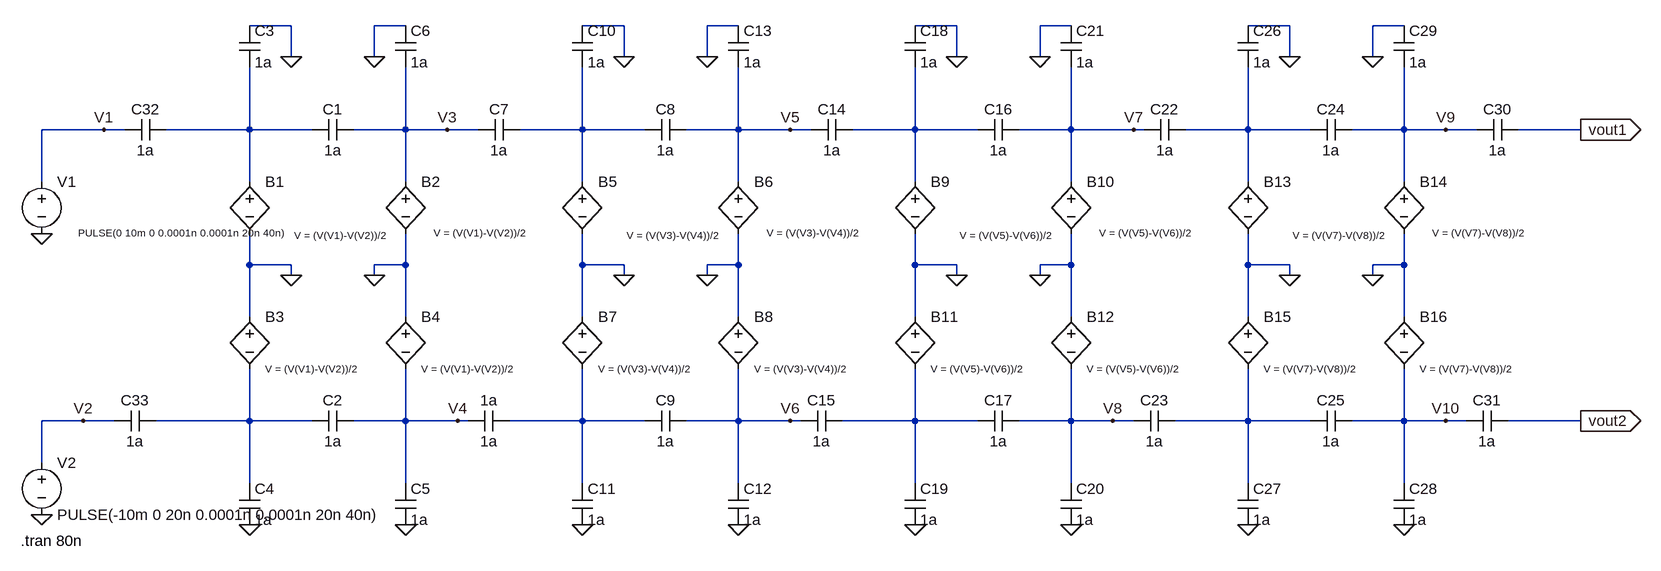
[diagram p0: schematic wire_in_ltspice.asc]
wire_in_ltspice.asc, the LTspice schematic file:
Version 4.1
SHEET 1 2044 680
WIRE -64 -256 -128 -256
WIRE 112 -256 64 -256
WIRE 448 -256 384 -256
WIRE 624 -256 576 -256
WIRE 960 -256 896 -256
WIRE 1136 -256 1088 -256
WIRE 1472 -256 1408 -256
WIRE 1648 -256 1600 -256
WIRE -64 -208 -64 -256
WIRE 64 -208 64 -256
WIRE 448 -208 448 -256
WIRE 576 -208 576 -256
WIRE 960 -208 960 -256
WIRE 1088 -208 1088 -256
WIRE 1472 -208 1472 -256
WIRE 1600 -208 1600 -256
WIRE -352 -96 -448 -96
WIRE -320 -96 -352 -96
WIRE -128 -96 -128 -192
WIRE -128 -96 -256 -96
WIRE -32 -96 -128 -96
WIRE 112 -96 112 -192
WIRE 112 -96 32 -96
WIRE 176 -96 112 -96
WIRE 224 -96 176 -96
WIRE 384 -96 384 -192
WIRE 384 -96 288 -96
WIRE 480 -96 384 -96
WIRE 624 -96 624 -192
WIRE 624 -96 544 -96
WIRE 704 -96 624 -96
WIRE 736 -96 704 -96
WIRE 896 -96 896 -192
WIRE 896 -96 800 -96
WIRE 992 -96 896 -96
WIRE 1136 -96 1136 -192
WIRE 1136 -96 1056 -96
WIRE 1232 -96 1136 -96
WIRE 1248 -96 1232 -96
WIRE 1408 -96 1408 -192
WIRE 1408 -96 1312 -96
WIRE 1504 -96 1408 -96
WIRE 1648 -96 1648 -192
WIRE 1648 -96 1568 -96
WIRE 1712 -96 1648 -96
WIRE 1760 -96 1712 -96
WIRE 1920 -96 1824 -96
WIRE -448 -16 -448 -96
WIRE -128 -16 -128 -96
WIRE 112 -16 112 -96
WIRE 384 -16 384 -96
WIRE 624 -16 624 -96
WIRE 896 -16 896 -96
WIRE 1136 -16 1136 -96
WIRE 1408 -16 1408 -96
WIRE 1648 -16 1648 -96
WIRE -128 112 -128 64
WIRE -64 112 -128 112
WIRE 112 112 112 64
WIRE 112 112 64 112
WIRE 384 112 384 64
WIRE 448 112 384 112
WIRE 624 112 624 64
WIRE 624 112 576 112
WIRE 896 112 896 64
WIRE 960 112 896 112
WIRE 1136 112 1136 64
WIRE 1136 112 1088 112
WIRE 1408 112 1408 64
WIRE 1472 112 1408 112
WIRE 1648 112 1648 64
WIRE 1648 112 1600 112
WIRE -64 128 -64 112
WIRE 64 128 64 112
WIRE 448 128 448 112
WIRE 576 128 576 112
WIRE 960 128 960 112
WIRE 1088 128 1088 112
WIRE 1472 128 1472 112
WIRE 1600 128 1600 112
WIRE -128 192 -128 112
WIRE 112 192 112 112
WIRE 384 192 384 112
WIRE 624 192 624 112
WIRE 896 192 896 112
WIRE 1136 192 1136 112
WIRE 1408 192 1408 112
WIRE 1648 192 1648 112
WIRE -384 352 -448 352
WIRE -336 352 -384 352
WIRE -128 352 -128 272
WIRE -128 352 -272 352
WIRE -32 352 -128 352
WIRE 112 352 112 272
WIRE 112 352 32 352
WIRE 192 352 112 352
WIRE 208 352 192 352
WIRE 384 352 384 272
WIRE 384 352 272 352
WIRE 480 352 384 352
WIRE 624 352 624 272
WIRE 624 352 544 352
WIRE 704 352 624 352
WIRE 720 352 704 352
WIRE 896 352 896 272
WIRE 896 352 784 352
WIRE 992 352 896 352
WIRE 1136 352 1136 272
WIRE 1136 352 1056 352
WIRE 1200 352 1136 352
WIRE 1232 352 1200 352
WIRE 1408 352 1408 272
WIRE 1408 352 1296 352
WIRE 1504 352 1408 352
WIRE 1648 352 1648 272
WIRE 1648 352 1568 352
WIRE 1712 352 1648 352
WIRE 1744 352 1712 352
WIRE 1920 352 1808 352
WIRE -448 416 -448 352
WIRE -128 448 -128 352
WIRE 112 448 112 352
WIRE 384 448 384 352
WIRE 624 448 624 352
WIRE 896 448 896 352
WIRE 1136 448 1136 352
WIRE 1408 448 1408 352
WIRE 1648 448 1648 352
FLAG -64 128 0
FLAG 64 128 0
FLAG -64 -208 0
FLAG 64 -208 0
FLAG 112 512 0
FLAG -128 512 0
FLAG 448 128 0
FLAG 576 128 0
FLAG 448 -208 0
FLAG 576 -208 0
FLAG 624 512 0
FLAG 384 512 0
FLAG 960 128 0
FLAG 1088 128 0
FLAG 960 -208 0
FLAG 1088 -208 0
FLAG 1136 512 0
FLAG 896 512 0
FLAG 1472 128 0
FLAG 1600 128 0
FLAG 1472 -208 0
FLAG 1600 -208 0
FLAG 1648 512 0
FLAG 1408 512 0
FLAG -448 64 0
FLAG -448 496 0
FLAG 1920 -96 vout1
IOPIN 1920 -96 Out
FLAG 1920 352 vout2
IOPIN 1920 352 Out
FLAG -352 -96 V1
FLAG -384 352 V2
FLAG 176 -96 V3
FLAG 704 -96 V5
FLAG 1232 -96 V7
FLAG 1712 -96 V9
FLAG 192 352 V4
FLAG 704 352 V6
FLAG 1200 352 V8
FLAG 1712 352 V10
SYMBOL cap 32 -112 R90
WINDOW 0 0 32 VBottom 2
WINDOW 3 32 32 VTop 2
SYMATTR InstName C1
SYMATTR Value 1a
SYMBOL cap 32 336 R90
WINDOW 0 0 32 VBottom 2
WINDOW 3 32 32 VTop 2
SYMATTR InstName C2
SYMATTR Value 1a
SYMBOL cap -144 -256 R0
SYMATTR InstName C3
SYMATTR Value 1a
SYMBOL cap -144 448 R0
SYMATTR InstName C4
SYMATTR Value 1a
SYMBOL cap 96 448 R0
SYMATTR InstName C5
SYMATTR Value 1a
SYMBOL cap 96 -256 R0
SYMATTR InstName C6
SYMATTR Value 1a
SYMBOL bv -128 -32 R0
WINDOW 3 139 109 Bottom 1
SYMATTR InstName B1
SYMATTR Value V = (V(V1)-V(V2))/2
SYMBOL bv 112 -32 R0
WINDOW 3 114 105 Bottom 1
SYMATTR InstName B2
SYMATTR Value V = (V(V1)-V(V2))/2
SYMBOL bv -128 176 R0
WINDOW 3 24 96 Left 1
SYMATTR InstName B3
SYMATTR Value V = (V(V1)-V(V2))/2
SYMBOL bv 112 176 R0
WINDOW 3 24 96 Left 1
SYMATTR InstName B4
SYMATTR Value V = (V(V1)-V(V2))/2
SYMBOL cap 288 -112 R90
WINDOW 0 0 32 VBottom 2
WINDOW 3 32 32 VTop 2
SYMATTR InstName C7
SYMATTR Value 1a
SYMBOL cap 272 336 R90
WINDOW 0 0 32 VBottom 2
WINDOW 3 32 32 VTop 2
SYMATTR InstName 1a
SYMATTR Value 1a
SYMBOL cap 544 -112 R90
WINDOW 0 0 32 VBottom 2
WINDOW 3 32 32 VTop 2
SYMATTR InstName C8
SYMATTR Value 1a
SYMBOL cap 544 336 R90
WINDOW 0 0 32 VBottom 2
WINDOW 3 32 32 VTop 2
SYMATTR InstName C9
SYMATTR Value 1a
SYMBOL cap 368 -256 R0
SYMATTR InstName C10
SYMATTR Value 1a
SYMBOL cap 368 448 R0
SYMATTR InstName C11
SYMATTR Value 1a
SYMBOL cap 608 448 R0
SYMATTR InstName C12
SYMATTR Value 1a
SYMBOL cap 608 -256 R0
SYMATTR InstName C13
SYMATTR Value 1a
SYMBOL bv 384 -32 R0
WINDOW 3 139 109 Bottom 1
SYMATTR InstName B5
SYMATTR Value V = (V(V3)-V(V4))/2
SYMBOL bv 624 -32 R0
WINDOW 3 114 105 Bottom 1
SYMATTR InstName B6
SYMATTR Value V = (V(V3)-V(V4))/2
SYMBOL bv 384 176 R0
WINDOW 3 24 96 Left 1
SYMATTR InstName B7
SYMATTR Value V = (V(V3)-V(V4))/2
SYMBOL bv 624 176 R0
WINDOW 3 24 96 Left 1
SYMATTR InstName B8
SYMATTR Value V = (V(V3)-V(V4))/2
SYMBOL cap 800 -112 R90
WINDOW 0 0 32 VBottom 2
WINDOW 3 32 32 VTop 2
SYMATTR InstName C14
SYMATTR Value 1a
SYMBOL cap 784 336 R90
WINDOW 0 0 32 VBottom 2
WINDOW 3 32 32 VTop 2
SYMATTR InstName C15
SYMATTR Value 1a
SYMBOL cap 1056 -112 R90
WINDOW 0 0 32 VBottom 2
WINDOW 3 32 32 VTop 2
SYMATTR InstName C16
SYMATTR Value 1a
SYMBOL cap 1056 336 R90
WINDOW 0 0 32 VBottom 2
WINDOW 3 32 32 VTop 2
SYMATTR InstName C17
SYMATTR Value 1a
SYMBOL cap 880 -256 R0
SYMATTR InstName C18
SYMATTR Value 1a
SYMBOL cap 880 448 R0
SYMATTR InstName C19
SYMATTR Value 1a
SYMBOL cap 1120 448 R0
SYMATTR InstName C20
SYMATTR Value 1a
SYMBOL cap 1120 -256 R0
SYMATTR InstName C21
SYMATTR Value 1a
SYMBOL bv 896 -32 R0
WINDOW 3 139 109 Bottom 1
SYMATTR InstName B9
SYMATTR Value V = (V(V5)-V(V6))/2
SYMBOL bv 1136 -32 R0
WINDOW 3 114 105 Bottom 1
SYMATTR InstName B10
SYMATTR Value V = (V(V5)-V(V6))/2
SYMBOL bv 896 176 R0
WINDOW 3 24 96 Left 1
SYMATTR InstName B11
SYMATTR Value V = (V(V5)-V(V6))/2
SYMBOL bv 1136 176 R0
WINDOW 3 24 96 Left 1
SYMATTR InstName B12
SYMATTR Value V = (V(V5)-V(V6))/2
SYMBOL cap 1312 -112 R90
WINDOW 0 0 32 VBottom 2
WINDOW 3 32 32 VTop 2
SYMATTR InstName C22
SYMATTR Value 1a
SYMBOL cap 1296 336 R90
WINDOW 0 0 32 VBottom 2
WINDOW 3 32 32 VTop 2
SYMATTR InstName C23
SYMATTR Value 1a
SYMBOL cap 1568 -112 R90
WINDOW 0 0 32 VBottom 2
WINDOW 3 32 32 VTop 2
SYMATTR InstName C24
SYMATTR Value 1a
SYMBOL cap 1568 336 R90
WINDOW 0 0 32 VBottom 2
WINDOW 3 32 32 VTop 2
SYMATTR InstName C25
SYMATTR Value 1a
SYMBOL cap 1392 -256 R0
SYMATTR InstName C26
SYMATTR Value 1a
SYMBOL cap 1392 448 R0
SYMATTR InstName C27
SYMATTR Value 1a
SYMBOL cap 1632 448 R0
SYMATTR InstName C28
SYMATTR Value 1a
SYMBOL cap 1632 -256 R0
SYMATTR InstName C29
SYMATTR Value 1a
SYMBOL bv 1408 -32 R0
WINDOW 3 139 109 Bottom 1
SYMATTR InstName B13
SYMATTR Value V = (V(V7)-V(V8))/2
SYMBOL bv 1648 -32 R0
WINDOW 3 114 105 Bottom 1
SYMATTR InstName B14
SYMATTR Value V = (V(V7)-V(V8))/2
SYMBOL bv 1408 176 R0
WINDOW 3 24 96 Left 1
SYMATTR InstName B15
SYMATTR Value V = (V(V7)-V(V8))/2
SYMBOL bv 1648 176 R0
WINDOW 3 24 96 Left 1
SYMATTR InstName B16
SYMATTR Value V = (V(V7)-V(V8))/2
SYMBOL cap 1824 -112 R90
WINDOW 0 0 32 VBottom 2
WINDOW 3 32 32 VTop 2
SYMATTR InstName C30
SYMATTR Value 1a
SYMBOL cap 1808 336 R90
WINDOW 0 0 32 VBottom 2
WINDOW 3 32 32 VTop 2
SYMATTR InstName C31
SYMATTR Value 1a
SYMBOL cap -256 -112 R90
WINDOW 0 0 32 VBottom 2
WINDOW 3 32 32 VTop 2
SYMATTR InstName C32
SYMATTR Value 1a
SYMBOL cap -272 336 R90
WINDOW 0 0 32 VBottom 2
WINDOW 3 32 32 VTop 2
SYMATTR InstName C33
SYMATTR Value 1a
SYMBOL voltage -448 -32 R0
WINDOW 3 212 105 Bottom 1
WINDOW 123 0 0 Left 0
WINDOW 39 0 0 Left 0
SYMATTR InstName V1
SYMATTR Value PULSE(0 10m 0 0.0001n 0.0001n 20n 40n)
SYMBOL voltage -448 400 R0
WINDOW 123 0 0 Left 0
WINDOW 39 0 0 Left 0
SYMATTR InstName V2
SYMATTR Value PULSE(-10m 0 20n 0.0001n 0.0001n 20n 40n)
TEXT -480 536 Left 2 !.tran 80n

The netlist it stands for:
* wire_in_ltspice.asc
C1 V3 N001 1a
C2 V4 N005 1a
C3 0 N001 1a
C4 N005 0 1a
C5 V4 0 1a
C6 0 V3 1a
B1 N001 0 V = (V(V1)-V(V2))/2
B2 V3 0 V = (V(V1)-V(V2))/2
B3 0 N005 V = (V(V1)-V(V2))/2
B4 0 V4 V = (V(V1)-V(V2))/2
C7 N002 V3 1a
C§1a N006 V4 1a
C8 V5 N002 1a
C9 V6 N006 1a
C10 0 N002 1a
C11 N006 0 1a
C12 V6 0 1a
C13 0 V5 1a
B5 N002 0 V = (V(V3)-V(V4))/2
B6 V5 0 V = (V(V3)-V(V4))/2
B7 0 N006 V = (V(V3)-V(V4))/2
B8 0 V6 V = (V(V3)-V(V4))/2
C14 N003 V5 1a
C15 N007 V6 1a
C16 V7 N003 1a
C17 V8 N007 1a
C18 0 N003 1a
C19 N007 0 1a
C20 V8 0 1a
C21 0 V7 1a
B9 N003 0 V = (V(V5)-V(V6))/2
B10 V7 0 V = (V(V5)-V(V6))/2
B11 0 N007 V = (V(V5)-V(V6))/2
B12 0 V8 V = (V(V5)-V(V6))/2
C22 N004 V7 1a
C23 N008 V8 1a
C24 V9 N004 1a
C25 V10 N008 1a
C26 0 N004 1a
C27 N008 0 1a
C28 V10 0 1a
C29 0 V9 1a
B13 N004 0 V = (V(V7)-V(V8))/2
B14 V9 0 V = (V(V7)-V(V8))/2
B15 0 N008 V = (V(V7)-V(V8))/2
B16 0 V10 V = (V(V7)-V(V8))/2
C30 vout1 V9 1a
C31 vout2 V10 1a
C32 N001 V1 1a
C33 N005 V2 1a
V1 V1 0 PULSE(0 10m 0 0.0001n 0.0001n 20n 40n)
V2 V2 0 PULSE(-10m 0 20n 0.0001n 0.0001n 20n 40n)
.tran 80n
.backanno
.end